# Altium schematic sheet Connectors.SchDoc
size A; SheetNumber: 1; SheetTotal: 5
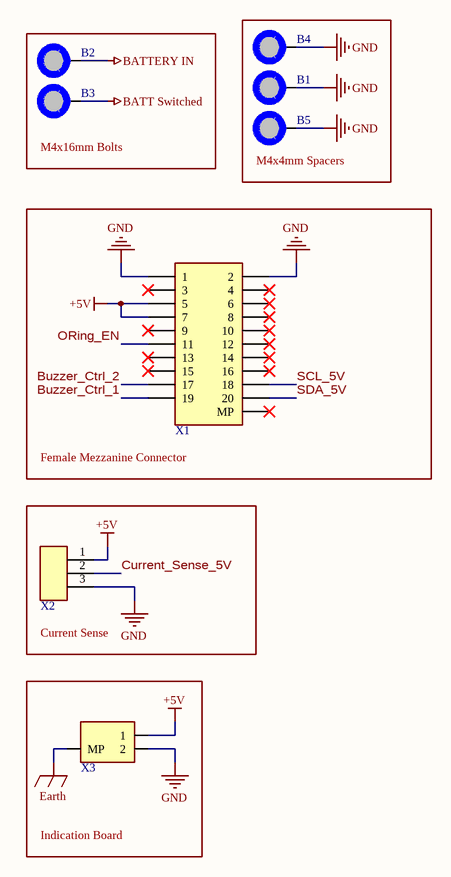
[diagram p0: Connectors.SchDoc]

## Parts
B1  M4 4mm Spacer  [[Bolt] M4 len=4mm OD=6mm Spacer]  (value not drawn)
B2  M4 16mm  [[Bolt] M4 16mm Button Head Hex Bolt]  (value not drawn)
B3  M4 16mm  [[Bolt] M4 16mm Button Head Hex Bolt]  (value not drawn)
B4  M4 4mm Spacer  [[Bolt] M4 len=4mm OD=6mm Spacer]  (value not drawn)
B5  M4 4mm Spacer  [[Bolt] M4 len=4mm OD=6mm Spacer]  (value not drawn)
X1  [Mezzanine] 20pin 0.4mm Female  [[Mezzanine] 20pin 0.4mm Female]  (value not drawn)
X2  [Sherlock] 3pin 90deg  [[Sherlock] 3pin 90deg]  (value not drawn)
X3  [Pheonix] 2pin 2.5mm pitch  [[Pheonix] 2pin 2.5mm pitch]  (value not drawn)

## Blocks framed on the sheet
M4x16mm Bolts: B2 B3
M4x4mm Spacers: B1 B4 B5
Female Mezzanine Connector: X1
Current Sense: X2
Indication Board: X3

## Nets
+5V: X1.5 X1.7 X2.1 X3.1
BATT Switched: B3.1
BATTERY IN: B2.1
Earth: X3.MP
GND: B1.1 B4.1 B5.1 X1.1 X1.2 X2.3 X3.2
Buzzer_Ctrl_1: X1.19
Buzzer_Ctrl_2: X1.17
Current_Sense_5V: X2.2
ORing_EN: X1.11
SCL_5V: X1.18
SDA_5V: X1.20

Not connected (* = marked no-connect by the designer): X1 3* 4* 6* 8* 9* 10* 12* 13* 14* 15* 16* MP*

## Library data of the parts
B1 B4 B5 = [Bolt] M4 len=4mm OD=6mm Spacer: ID: 4mm / OD: 6mm; System: Connector; ComponentLink1Description: McMaster Supplier; ComponentLink1URL: https://www.mcmaster.com/94669A006/
B2 B3 = [Bolt] M4 16mm Button Head Hex Bolt: 92095A194; System: Connector; ComponentLink1Description: McMaster Link; ComponentLink1URL: https://www.mcmaster.com/92095A194/
X1 = [Mezzanine] 20pin 0.4mm Female: DF40C-20DP-0.4V(51); System: Connector; Supplier 1: DigiKey; Supplier Part Number 1: H11618CT-ND
X2 = [Sherlock] 3pin 90deg: 0353630360; Supplier 1: DigiKey; Supplier Part Number 1: WM18932-ND
X3 = [Pheonix] 2pin 2.5mm pitch: 1778764; System: Connector; Supplier 1: DigiKey; Supplier Part Number 1: 277-2315-1-ND